# Altium schematic sheet Top-Sheet.SchDoc
size A4; SheetNumber: 1; SheetTotal: 6
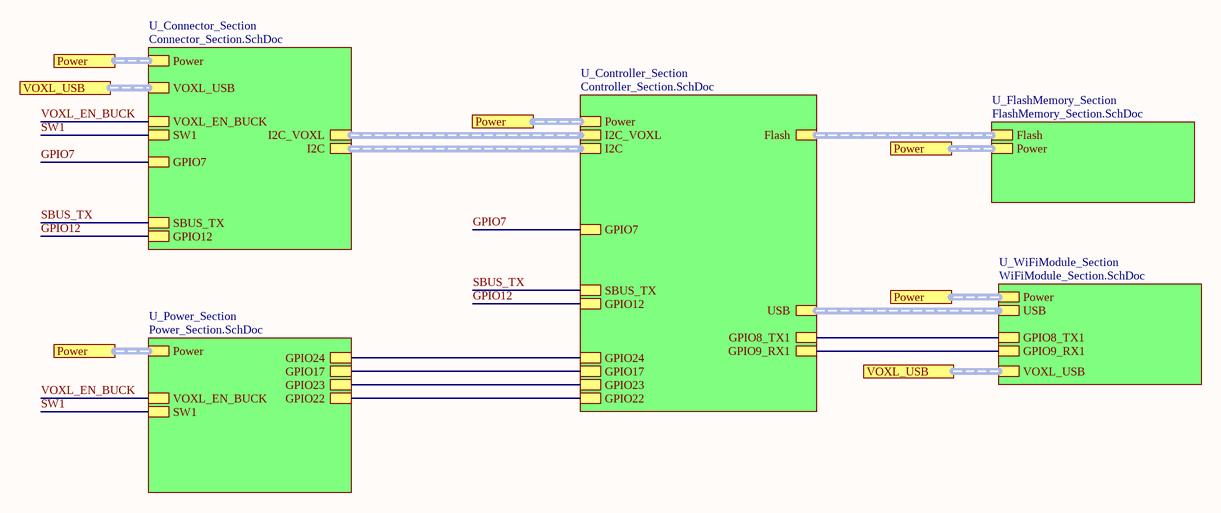
[diagram p0: Top-Sheet.SchDoc]

## Sub-sheets
U_Connector_Section = Connector_Section.SchDoc: Power (harness Power), I2C_VOXL (harness I2C_VOXL), I2C (harness I2C), VOXL_USB (harness VOXL_USB), SW1, VOXL_EN_BUCK, GPIO7, SBUS_TX, GPIO12
U_Controller_Section = Controller_Section.SchDoc: Flash (harness Flash), Power (harness Power), I2C_VOXL (harness I2C_VOXL), I2C (harness I2C), USB (harness USB), GPIO7, SBUS_TX, GPIO12, GPIO8_TX1, GPIO9_RX1, GPIO24, GPIO17, GPIO23, GPIO22
U_FlashMemory_Section = FlashMemory_Section.SchDoc: Flash (harness Flash), Power (harness Power)
U_Power_Section = Power_Section.SchDoc: Power (harness Power), SW1, VOXL_EN_BUCK, GPIO24, GPIO17, GPIO23, GPIO22
U_WiFiModule_Section = WiFiModule_Section.SchDoc: VOXL_USB (harness VOXL_USB), USB (harness USB), GPIO8_TX1, GPIO9_RX1, Power (harness Power)

## Ports
Power, VOXL_USB

## Nets
GPIO7: sheet U_Connector_Section/GPIO7, sheet U_Controller_Section/GPIO7
GPIO12: sheet U_Connector_Section/GPIO12, sheet U_Controller_Section/GPIO12
SBUS_TX: sheet U_Connector_Section/SBUS_TX, sheet U_Controller_Section/SBUS_TX
SW1: sheet U_Connector_Section/SW1, sheet U_Power_Section/SW1
VOXL_EN_BUCK: sheet U_Connector_Section/VOXL_EN_BUCK, sheet U_Power_Section/VOXL_EN_BUCK
(unnamed): sheet U_Controller_Section/GPIO8_TX1, sheet U_WiFiModule_Section/GPIO8_TX1
(unnamed): sheet U_Controller_Section/GPIO9_RX1, sheet U_WiFiModule_Section/GPIO9_RX1
(unnamed): sheet U_Controller_Section/GPIO24, sheet U_Power_Section/GPIO24
(unnamed): sheet U_Controller_Section/GPIO17, sheet U_Power_Section/GPIO17
(unnamed): sheet U_Controller_Section/GPIO23, sheet U_Power_Section/GPIO23
(unnamed): sheet U_Controller_Section/GPIO22, sheet U_Power_Section/GPIO22

## Buses and harness runs
harness port Power = sheet U_Connector_Section/Power
harness port Power = sheet U_Controller_Section/Power
harness port Power = sheet U_FlashMemory_Section/Power
harness port Power = sheet U_Power_Section/Power
harness port Power = sheet U_WiFiModule_Section/Power
harness port VOXL_USB = sheet U_Connector_Section/VOXL_USB
harness port VOXL_USB = sheet U_WiFiModule_Section/VOXL_USB
harness sheet U_Connector_Section/I2C = sheet U_Controller_Section/I2C
harness sheet U_Connector_Section/I2C_VOXL = sheet U_Controller_Section/I2C_VOXL
harness sheet U_Controller_Section/Flash = sheet U_FlashMemory_Section/Flash
harness sheet U_Controller_Section/USB = sheet U_WiFiModule_Section/USB

## Notes on the sheet
- File:
- Title:
- Date:
- Page
- Num:
- Total:
- Drawn By: Huzaifa Ali